# EAGLE design SMPS-BENCH (EAGLE 9.6.2)
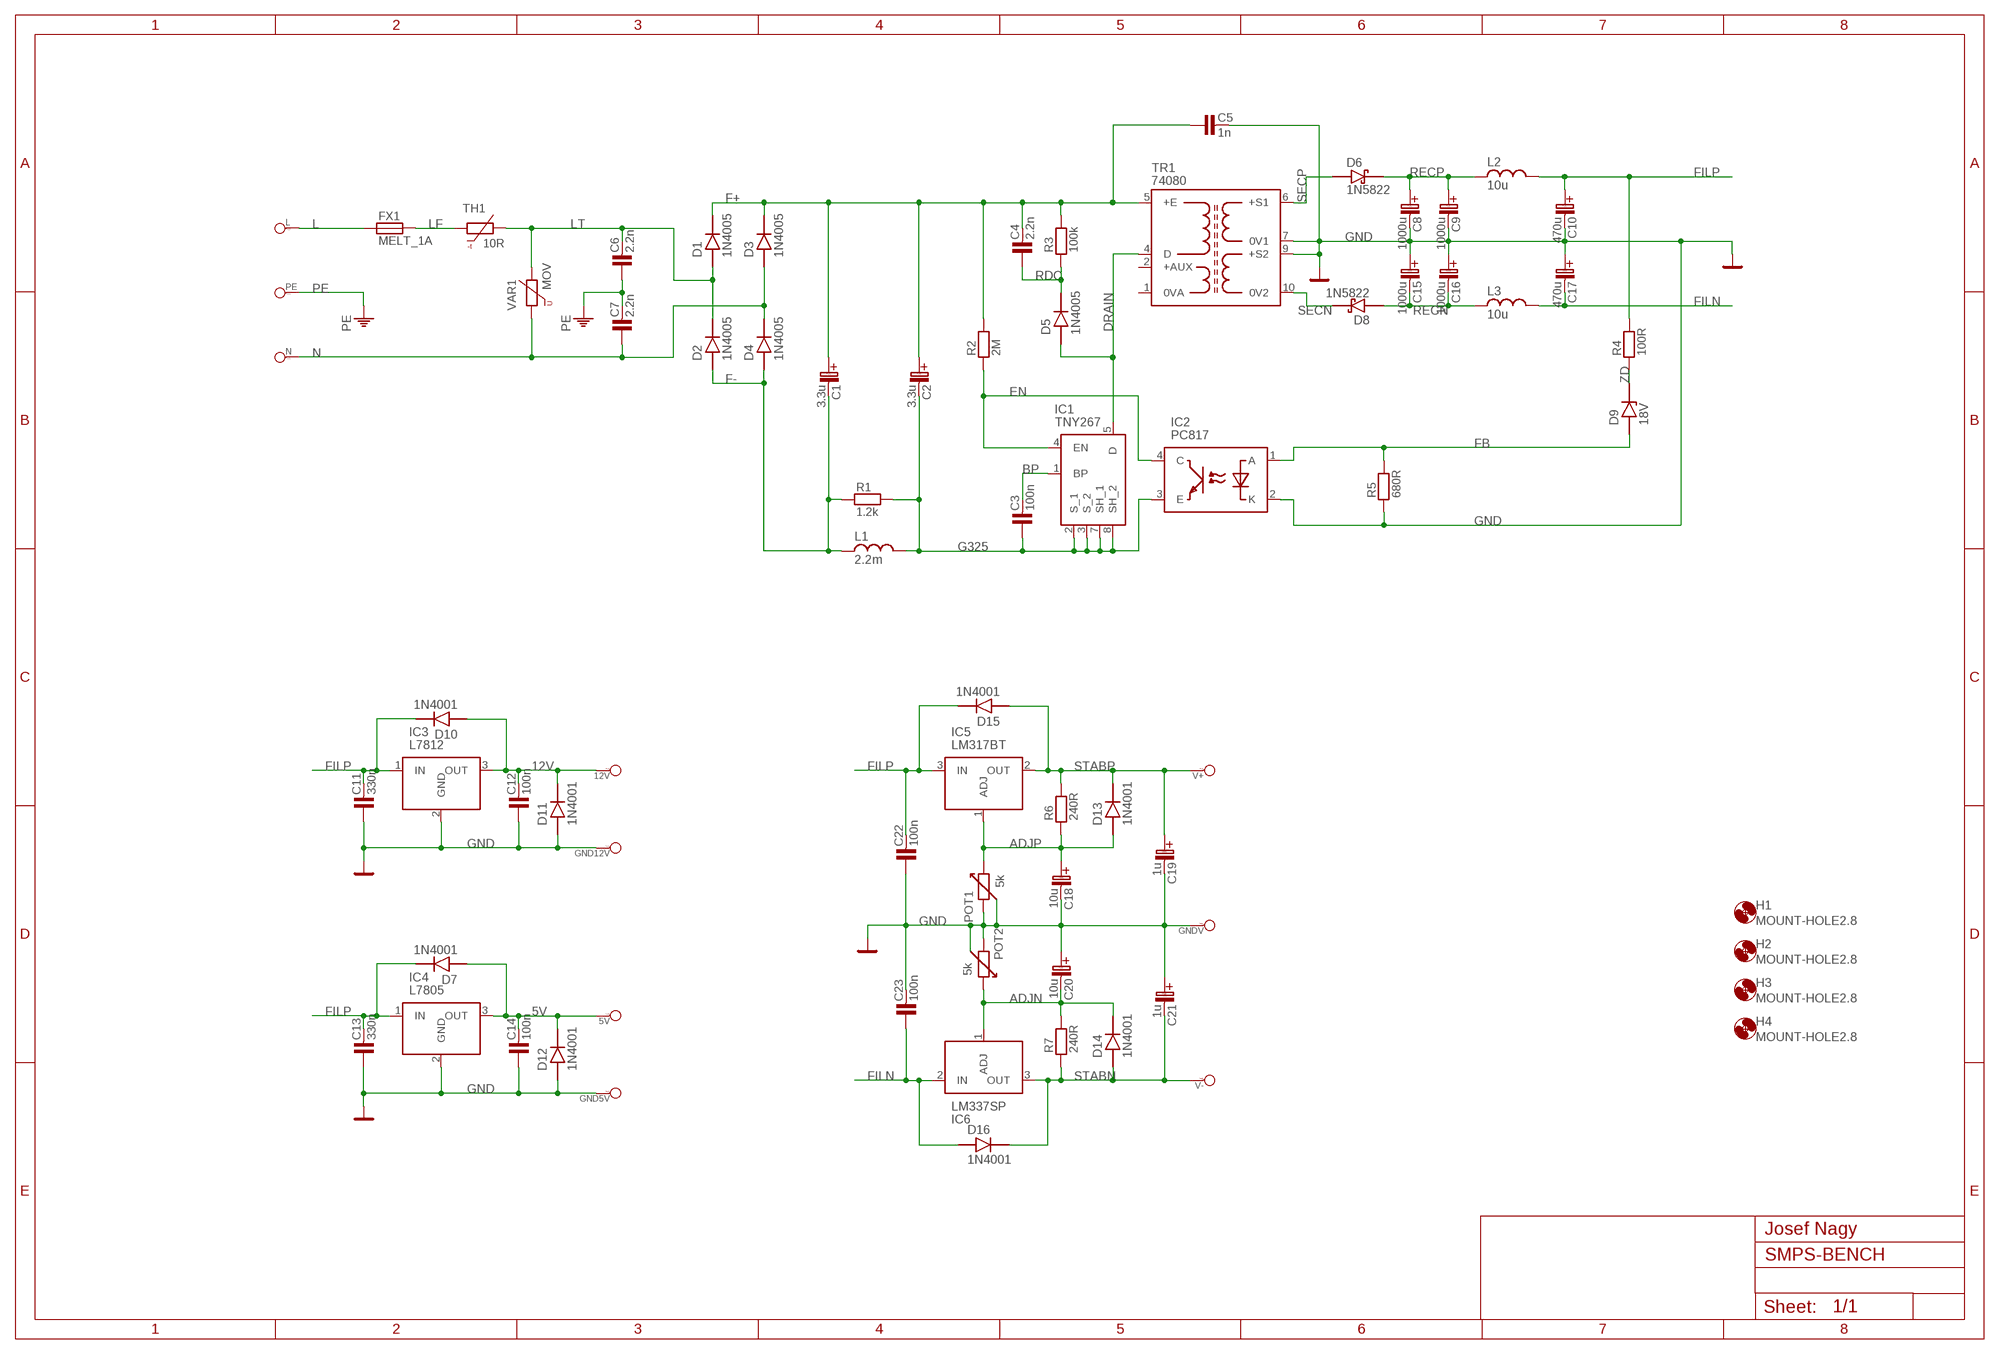
[diagram p0: schematic, sheet 1]

## Parts
5V  PAD_1  [PAD_1]
12V  PAD_1  [PAD_1]
C1  3.3u  C-EL_5  [C-EL_5]
C2  3.3u  C-EL_5  [C-EL_5]
C3  100n  C_KER_10  [C-10]
C4  2.2n  C_KER_10  [C-10]
C5  1n  C_KER_10  [C-10]
C6  2.2n  C_KER_10  [C-10]
C7  2.2n  C_KER_10  [C-10]
C8  1000u  C-EL_5  [C-EL_5]
C9  1000u  C-EL_5  [C-EL_5]
C10  470u  C-EL_5  [C-EL_5]
C11  330n  C_KER_5  [C-5]
C12  100n  C_KER_2,5  [C-2,5]
C13  330n  C_KER_5  [C-5]
C14  100n  C_KER_2,5  [C-2,5]
C15  1000u  C-EL_5  [C-EL_5]
C16  1000u  C-EL_5  [C-EL_5]
C17  470u  C-EL_5  [C-EL_5]
C18  10u  C-EL_2  [C-EL_2]
C19  1u  C-EL_2  [C-EL_2]
C20  10u  C-EL_2  [C-EL_2]
C21  1u  C-EL_2  [C-EL_2]
C22  100n  C_KER_5  [C-5]
C23  100n  C_KER_5  [C-5]
D1  1N4005  D_DO41  [DO41]
D2  1N4005  D_DO41  [DO41]
D3  1N4005  D_DO41  [DO41]
D4  1N4005  D_DO41  [DO41]
D5  1N4005  D_DO41  [DO41]
D6  1N5822  D-SCHOTTKY_DO201V  [DO201_V]
D7  1N4001  D_DO41  [DO41]
D8  1N5822  D-SCHOTTKY_DO201V  [DO201_V]
D9  18V  D-ZENER_DO35  [DO35]
D10  1N4001  D_DO41  [DO41]
D11  1N4001  D_DO41  [DO41]
D12  1N4001  D_DO41  [DO41]
D13  1N4001  D_DO41  [DO41]
D14  1N4001  D_DO41  [DO41]
D15  1N4001  D_DO41  [DO41]
D16  1N4001  D_DO41  [DO41]
FX1  MELT_1A  FUSE_M  [FUSE_MELT]
GND5V  PAD_1  [PAD_1]
GND12V  PAD_1  [PAD_1]
GNDV  PAD_1  [PAD_1]
H1  MOUNT-HOLE2.8  [2,8]
H2  MOUNT-HOLE2.8  [2,8]
H3  MOUNT-HOLE2.8  [2,8]
H4  MOUNT-HOLE2.8  [2,8]
IC1  TNY267  TNY267PN  [P-PACKAGE(DIP-8B)_1]
IC2  PC817  PC817X4NSZ1B  [DIP762W60P254L460H455Q4N]
IC3  L7812  L78XX  [TO255P460X1020X2008-3P]
IC4  L7805  L78XX  [TO255P460X1020X2008-3P]
IC5  LM317BT  [TO255P460X1020X2008-3P]
IC6  LM337SP  [TO255P460X1020X2008-3P]
L  PAD_1  [PAD_1]
L1  2.2m  L_5  [L-5]
L2  10u  L_3  [L-3]
L3  10u  L_3  [L-3]
N  PAD_1  [PAD_1]
PE  PAD_1  [PAD_1]
POT1  5k  POTENTIOMETER_1  [POT]
POT2  5k  POTENTIOMETER_1  [POT]
R1  1.2k  R_7,5  [R-7,5]
R2  2M  R_STOJ2  [R-STOJ2]
R3  100k  R_7,5  [R-7,5]
R4  100R  R_7,5  [R-7,5]
R5  680R  R_7,5  [R-7,5]
R6  240R  R_5  [R-5]
R7  240R  R_5  [R-5]
TH1  10R  THERMISTOR_1  [THERMISTOR]
TR1  74080  [74080]
V+  PAD_1  [PAD_1]
V-  PAD_1  [PAD_1]
VAR1  MOV  VARISTOR_1  [MOV_VARISTOR]

## Nets
5V: 5V.1 C14.2 D7.A D12.K(C) IC4.3(OUT)
12V: 12V.1 C12.2 D10.A D11.K(C) IC3.3(OUT)
ADJN: C20.C-(C_EL-) D14.K(C) IC6.1(ADJ) POT2.3 R7.2
ADJP: C18.C+(C_EL+) D13.A IC5.1(ADJ) POT1.3 R6.1
BP: C3.2 IC1.1(BP)
DRAIN: D5.A IC1.5(D) TR1.4(D)
EN: IC1.4(EN) IC2.4(C) R2.1
F+: C1.C+(C_EL+) C2.C+(C_EL+) C4.2 C5.1 D1.K(C) D3.K(C) R2.2 R3.2 TR1.5(+E)
F-: C1.C-(C_EL-) D2.A D4.A L1.1 R1.1
FB: D9.A IC2.1(A) R5.2
FILN: C17.C-(C_EL-) C23.1 D16.A IC6.2(IN) L3.2
FILP: C10.C+(C_EL+) C11.2 C13.2 C22.2 D7.K(C) D10.K(C) D15.K(C) IC3.1(IN) IC4.1(IN) IC5.3(IN) L2.2 R4.2
G325: C2.C-(C_EL-) C3.1 IC1.2(S_1) IC1.3(S_2) IC1.7(SH_1) IC1.8(SH_2) IC2.3(E) L1.2 R1.2
GND: C5.2 C8.C-(C_EL-) C9.C-(C_EL-) C10.C-(C_EL-) C11.1 C12.1 C13.1 C14.1 C15.C+(C_EL+) C16.C+(C_EL+) C17.C+(C_EL+) C18.C-(C_EL-) C19.C-(C_EL-) C20.C+(C_EL+) C21.C+(C_EL+) C22.1 C23.2 D11.A D12.A GND5V.1 GND12V.1 GNDV.1 IC2.2(K) IC3.2(GND) IC4.2(GND) POT1.1 POT1.2 POT2.1 POT2.2 R5.1 TR1.7(0V1) TR1.9(+S2)
L: FX1.1 L.1
LF: FX1.2 TH1.1
LT: C6.2 D1.A D2.K(C) TH1.2 VAR1.2
N: C7.1 D3.A D4.K(C) N.1 VAR1.1
PE: C6.1 C7.2 PE.1
RDC: C4.1 D5.K(C) R3.1
RECN: C15.C-(C_EL-) C16.C-(C_EL-) D8.A L3.1
RECP: C8.C+(C_EL+) C9.C+(C_EL+) D6.K(C) L2.1
SECN: D8.K(C) TR1.10(0V2)
SECP: D6.A TR1.6(+S1)
STABN: C21.C-(C_EL-) D14.A D16.K(C) IC6.3(OUT) R7.1 V-.1
STABP: C19.C+(C_EL+) D13.K(C) D15.A IC5.2(OUT) R6.2 V+.1
ZD: D9.K(C) R4.1
Unconnected: TR1.1(0VA) TR1.2(+AUX)

## Notes on the sheet
- Josef Nagy

## Library data of the parts
5V 12V GND5V GND12V GNDV L N PE V+ V- = #PaJa_31:PAD_1: Pajeci bod - 2,54 mm prumer
C1 C2 C8-C10 C15-C21 = #_NG_knihovna:C-EL: Kondenzator - elektrolyticky
C3-C7 C11-C14 C22 C23 = #_NG_knihovna:C_KER: Kondenzator - keramicky
D1-D5 D7 D10-D16 = #_NG_knihovna:D
D6 D8 = #_NG_knihovna:D-SCHOTTKY; SPICEPREFIX: D
D9 = #_NG_knihovna:D-ZENER
FX1 = #_NG_knihovna:FUSE
H1-H4 = #_NG_knihovna:MOUNT-HOLE: MOUNTING HOLE with drill center marker
IC1 = #_NG_knihovna:TNY267PN: AC/DC Converters 12W 85-265 VAC 19W/230 VAC Source: Datasheet <https://componentsearchengine.com/Datasheets/1/TNY267PN.pdf>; DESCRIPTION: AC/DC Converters 12W 85-265 VAC 19W/230 VAC; HEIGHT: mm; MANUFACTURER_NAME: Power Integrations; MANUFACTURER_PART_NUMBER: TNY267PN
IC2 = #_NG_knihovna:PC817X4NSZ1B: Transistor Output Optocouplers OPTOISOLATOR 5KV TRANS DIP, Optoisolator Transistor Output 1 Channel Source: Datasheet <https://componentsearchengine.com/Datasheets/1/PC817X4NSZ1B.pdf>; DESCRIPTION: Transistor Output Optocouplers OPTOISOLATOR 5KV TRANS DIP, Optoisolator Transistor Output 1 Channel; HEIGHT: 4.55mm; MANUFACTURER_NAME: Sharp Microelectronics; MANUFACTURER_PART_NUMBER: PC817X4NSZ1B
IC3 IC4 = #_NG_knihovna:L78XX
IC5 = #_NG_knihovna:LM317BT: Standard Regulator Pos 1.2V to 37V 0.4A 3-Pin(3+Tab) TO-220AB Tube Source: Datasheet <https://www.st.com/resource/en/datasheet/lm317.pdf>; DESCRIPTION: Standard Regulator Pos 1.2V to 37V 0.4A 3-Pin(3+Tab) TO-220AB Tube; HEIGHT: 4.6mm; MANUFACTURER_NAME: STMicroelectronics; MANUFACTURER_PART_NUMBER: LM317BT
IC6 = #_NG_knihovna:LM337SP: Source: Datasheet <http://www.st.com/web/en/resource/technical/document/datasheet/CD00000468.pdf>; HEIGHT: 4.6mm; MANUFACTURER_NAME: STMicroelectronics; MANUFACTURER_PART_NUMBER: LM337SP
L1-L3 = #_NG_knihovna:L
POT1 POT2 = #_NG_knihovna:POTENTIOMETER
R1-R7 = #_NG_knihovna:R: Rezistor
TH1 = #_NG_knihovna:THERMISTOR
TR1 = #_NG_knihovna:74080: Transformer: impulse; 185VAC,265VAC; 915V; 915V; 1.5A; 1.5A; PCB Source: Datasheet <https://www.tme.com/Document/74b1c6fdfa5c80edd28be424718b4d1b/74080.pdf>; DESCRIPTION: Transformer: impulse; 185VAC,265VAC; 915V; 915V; 1.5A; 1.5A; PCB; HEIGHT: 18mm; MANUFACTURER_NAME: MYRRA; MANUFACTURER_PART_NUMBER: 74080
VAR1 = #_NG_knihovna:VARISTOR

## Board
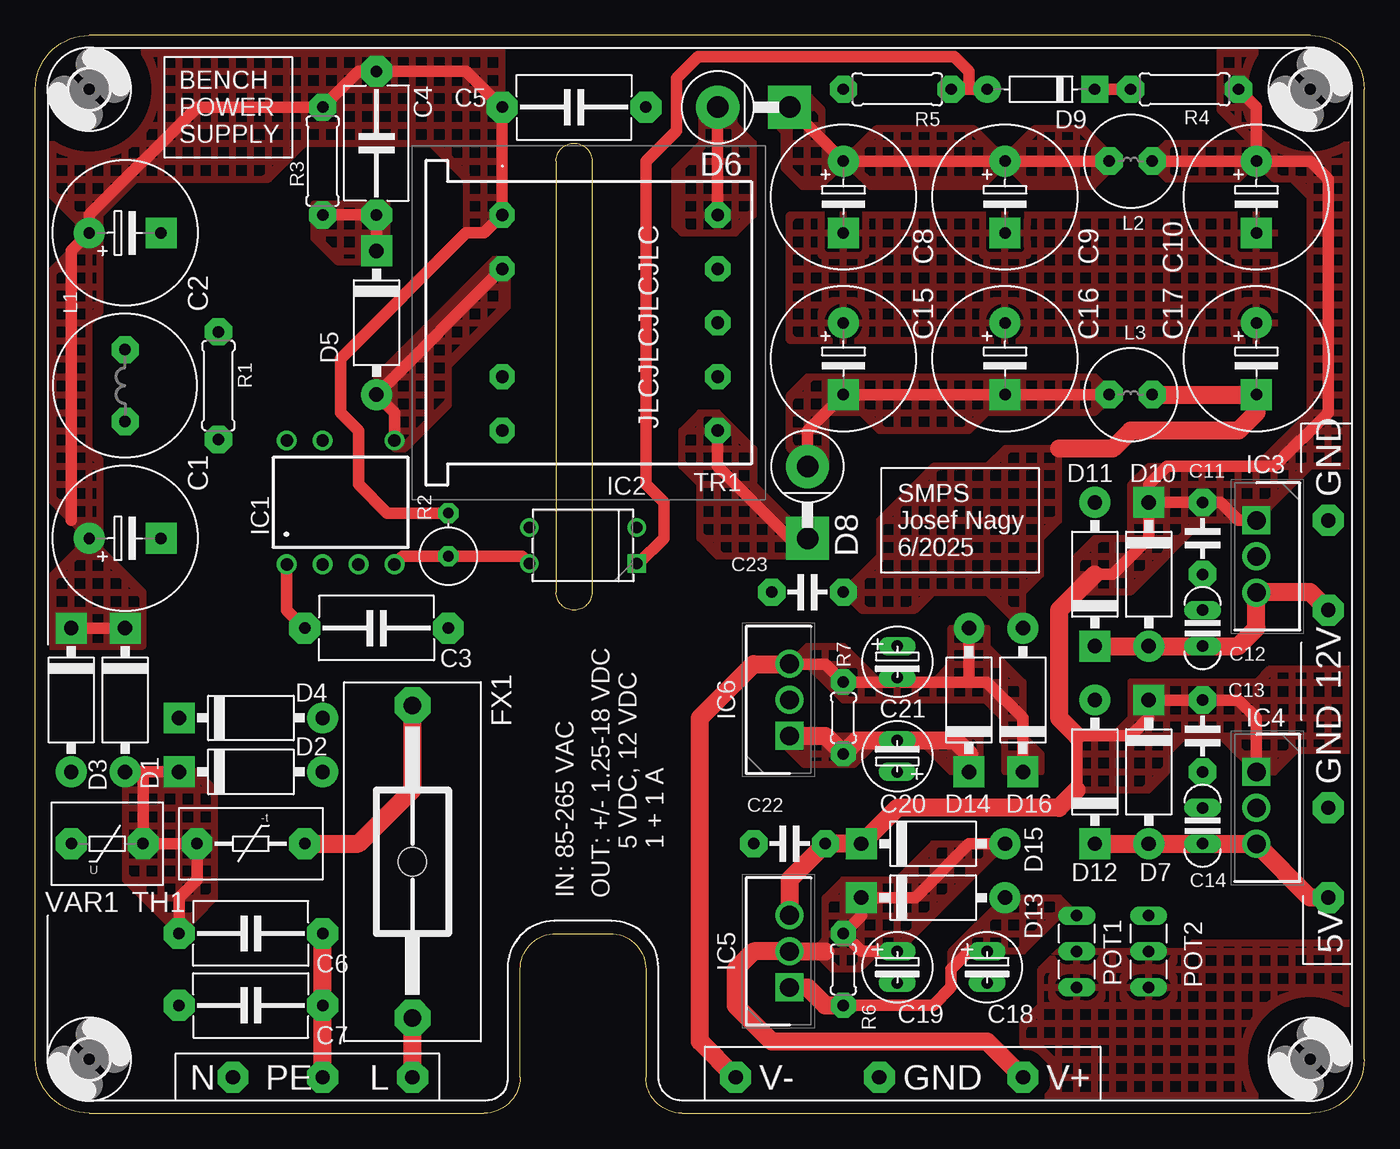
[diagram p1: board, top side]
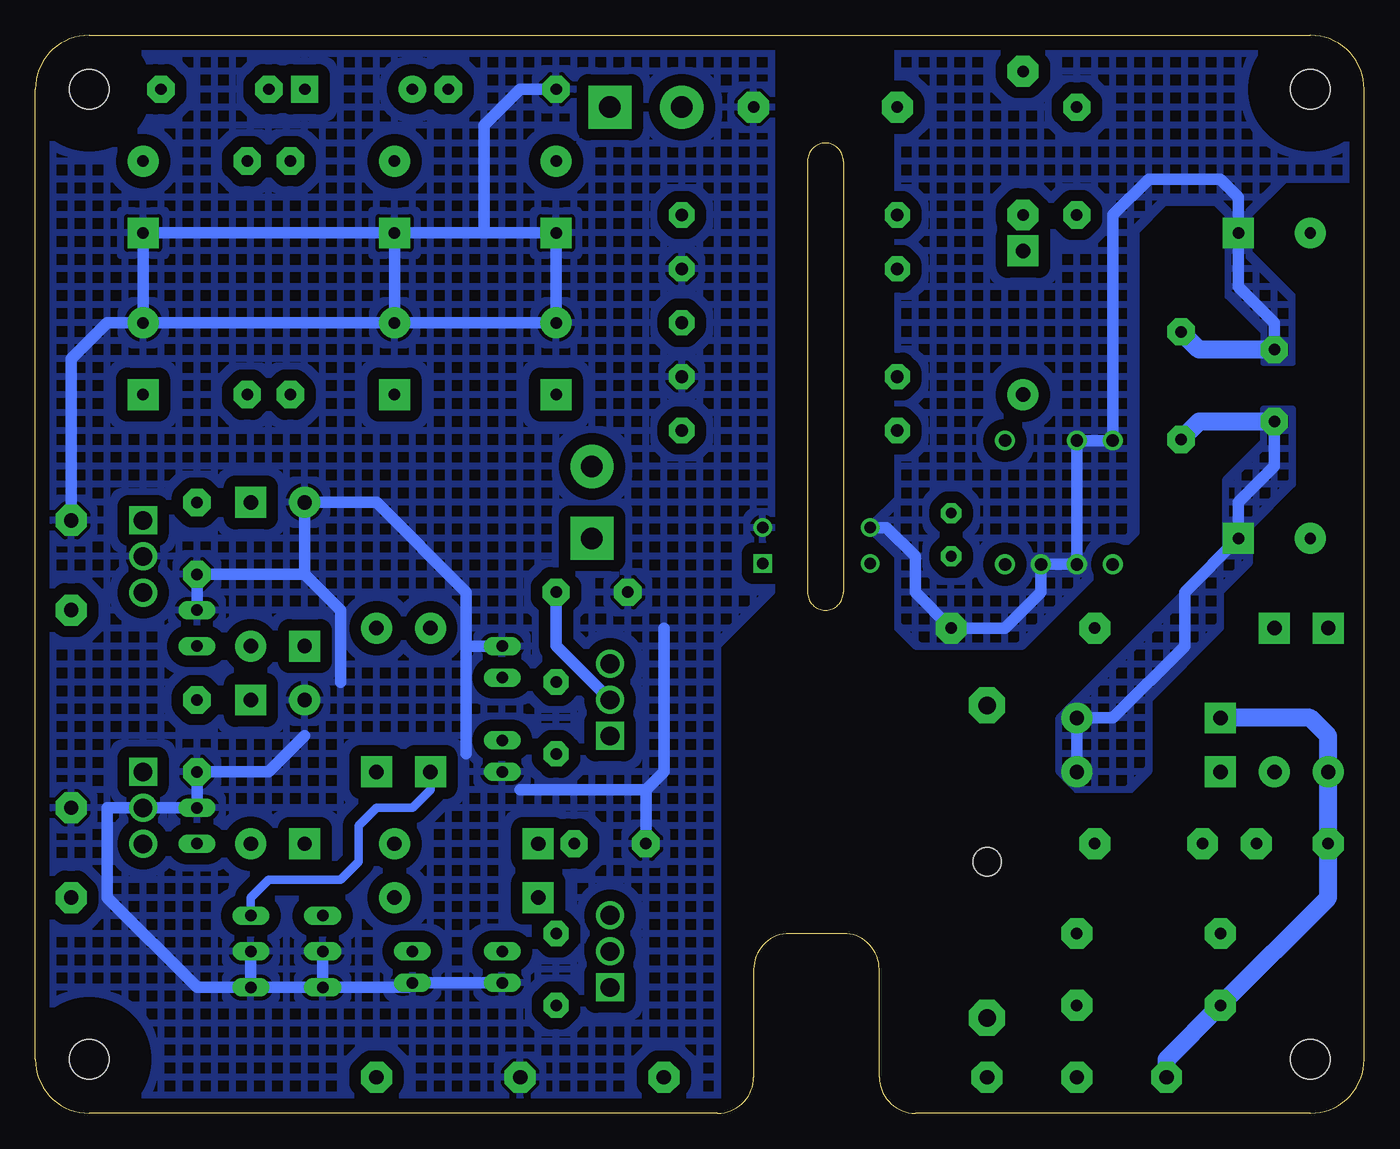
[diagram p2: board, bottom side, seen from below]

Size 93.98 x 76.2 mm. Coordinates in mm from the lower left corner, seen from the top.
Outline: 0,72.39 arc-90 3.81,76.2 90.17,76.2 arc-90 93.98,72.39 93.98,3.81 arc-90 90.17,0 45.72,0 arc-90 43.18,2.54 43.18,10.16 arc90 40.64,12.7 36.83,12.7 arc90 34.29,10.16 34.29,2.54 arc-90 31.75,0 3.81,0 arc-90 0,3.81 0,72.39
Outline: 36.83,67.31 36.83,36.83 arc180 39.37,36.83 39.37,67.31 arc180 36.83,67.31
Copper layers (1*16): Top 0.035mm / dielectric 1.5mm / Bottom 0.035mm
Design rules "default": minimum track width 6mil, minimum drill 0.35mm, track to track 6mil, track to pad 6mil, pad to pad 6mil, via to via 6mil, smd to smd 6mil, copper to edge 40mil, drill to drill 6mil, minimum pad ring 10mil, minimum via ring 8mil, stop-mask expansion 4mil, vias tented up to drill 0mil, thermal gap 10mil

### Footprints (pad centres in the part's own frame; a part is rotated, then mirrored left to right if it is on the bottom)
PAD_1 = drill 1.016 pad 2.184 octagon: 1 0,0
C-EL_5 = drill 0.813 pad 2.184: C+ -2.54,0 | drill 0.813 pad 2.184 square: C- 2.54,0
C-10 = drill 0.813 pad 2.184 octagon: 1 -5.08,0; 2 5.08,0
C-5 = drill 0.813 pad 1.93 octagon: 1 -2.54,0; 2 2.54,0
C-2,5 = drill 0.813 pad 1.27 long: 1 -1.27,0; 2 1.27,0
C-EL_2 = drill 0.813 pad 1.27 long: C+ 0,0; C- 2.223,0
DO41 = drill 1.016 pad 2.184: A -5.08,0 | drill 1.016 pad 2.184 square: K 5.08,0
DO201_V = drill 1.524 pad 3.048: A -2.54,0 | drill 1.524 pad 3.048 square: K 2.54,0
DO35 = drill 0.813 pad 1.93: A -3.81,0 | drill 0.813 pad 1.93 square: K 3.81,0
FUSE_MELT = drill 1.219 pad 2.54 octagon: 1 -11.049,0; 2 11.049,0 | hole 2: 0,0
2,8 = hole 2.8: 0,0
P-PACKAGE(DIP-8B)_1 = drill 0.88 pad 1.4: 1 -3.81,-4.375; 2 -1.27,-4.375; 3 1.27,-4.375; 4 3.81,-4.375; 5 3.81,4.375; 7 -1.27,4.375; 8 -3.81,4.375
DIP762W60P254L460H455Q4N = drill 0.8 pad 1.27 square: 1 -3.81,1.27 | drill 0.8 pad 1.27: 2 -3.81,-1.27; 3 3.81,-1.27; 4 3.81,1.27
TO255P460X1020X2008-3P = drill 1.32 pad 1.98 square: 1 0,0 | drill 1.32 pad 1.98: 2 2.55,0; 3 5.1,0
L-5 = drill 0.813 pad 1.93 octagon: 1 -2.54,0; 2 2.54,0
L-3 = drill 0.813 pad 1.93 octagon: 1 -1.524,0; 2 1.524,0
POT = drill 0.813 long: 1 -2.54,0; 2 0,0; 3 2.54,0
R-7,5 = drill 0.813 pad 1.93 octagon: 1 -3.81,0; 2 3.81,0
R-STOJ2 = drill 0.75 pad 1.422 octagon: 1 -1.27,0; 2 1.778,0
R-5 = drill 0.813 pad 1.778 octagon: 1 -2.54,0; 2 2.54,0
THERMISTOR = drill 0.813 pad 2.184 octagon: 1 -3.81,0; 2 3.81,0
74080 = drill 0.9 pad 1.778 octagon: 1 0,-15.24; 2 0,-11.43; 4 0,-3.81; 5 0,0; 6 15.24,0; 7 15.24,-3.81; 8 15.24,-7.62; 9 15.24,-11.43; 10 15.24,-15.24
MOV_VARISTOR = drill 0.813 pad 2.184 octagon: 1 -2.54,0; 2 2.54,0

### Placement (x,y rotation side)
5V  91.44,15.24 270 top
12V  91.44,35.56 270 top
C1  6.35,40.64 0 top
C2  6.35,62.23 0 top
C3  24.13,34.29 180 top
C4  24.13,68.58 90 top
C5  38.1,71.12 0 top
C6  15.24,12.7 180 top
C7  15.24,7.62 0 top
C8  57.15,64.77 270 top
C9  68.58,64.77 270 top
C10  86.36,64.77 270 top
C11  82.55,40.64 90 top
C12  82.55,34.29 270 top
C13  82.55,26.67 90 top
C14  82.55,20.32 270 top
C15  57.15,53.34 270 top
C16  68.58,53.34 270 top
C17  86.36,53.34 270 top
C18  67.31,11.43 270 top
C19  60.96,11.43 270 top
C20  60.96,24.13 90 top
C21  60.96,33.02 270 top
C22  53.34,19.05 0 top
C23  54.61,36.83 180 top
D1  6.35,29.21 90 top
D2  15.24,24.13 180 top
D3  2.54,29.21 90 top
D4  15.24,27.94 180 top
D5  24.13,55.88 90 top
D6  50.8,71.12 0 top
D7  78.74,24.13 90 top
D8  54.61,43.18 270 top
D9  71.12,72.39 0 top
D10  78.74,38.1 90 top
D11  74.93,38.1 270 top
D12  74.93,24.13 270 top
D13  63.5,15.24 180 top
D14  66.04,29.21 270 top
D15  63.5,19.05 180 top
D16  69.85,29.21 270 top
FX1  26.67,17.78 90 top
GND5V  91.44,21.59 270 top
GND12V  91.44,41.91 270 top
GNDV  59.69,2.54 0 top
H1  3.81,3.81 0 top
H2  3.81,72.39 0 top
H3  90.17,3.81 0 top
H4  90.17,72.39 0 top
IC1  21.59,43.18 0 top
IC2  38.73,40.13 180 top
IC3  86.36,41.91 270 top
IC4  86.36,24.13 270 top
IC5  53.34,8.89 90 top
IC6  53.34,26.67 90 top
L  26.67,2.54 0 top
L1  6.35,51.44 90 top
L2  77.47,67.31 0 top
L3  77.47,50.8 0 top
N  13.97,2.54 0 top
PE  20.32,2.54 0 top
POT1  73.66,11.43 90 top
POT2  78.74,11.43 90 top
R1  12.95,51.44 90 top
R2  29.21,40.64 90 top
R3  20.32,67.31 90 top
R4  81.28,72.39 0 top
R5  60.96,72.39 0 top
R6  57.15,10.16 90 top
R7  57.15,27.94 270 top
TH1  15.24,19.05 180 top
TR1  33.02,63.5 0 top
V+  69.85,2.54 0 top
V-  49.53,2.54 0 top
VAR1  5.08,19.05 0 top

### Tracks (layer width: path | path; a pad name or v marks a point on that pad's centre or on a via)
5V
  Top 1.27: D12.K D7.A C14.2 86.34,19.05 IC4.3 90.15,15.24 5V.1
12V
  Top 1.27: D11.K D10.A C12.2 85.09,33.02 86.36,34.29 IC3.3 86.38,36.83 90.17,36.83 12V.1
ADJN
  Top 1.27: IC6.1 55.88,26.67 R7.2 58.1,26.35 C20.C- 65.09,26.35 66.04,25.4 D14.K
  Bottom 0.61: D14.K 66.04,22.86 67.31,21.59 69.85,21.59 71.12,20.32 71.12,17.78 72.39,16.51 77.47,16.51 78.74,15.24 POT2.3
  pour Top (isolate 0.813, no thermals, hatched): 53.34,26.67 66.8,26.67 66.8,24.13 64.77,24.13 62.87,26.04 59.31,26.04 57.91,24.64 54.36,24.64 53.09,25.91 53.09,26.42
ADJP
  Top 0.813: C18.C+ 66.04,11.43 64.77,10.16 64.77,8.89 63.5,7.62 R6.1
  Top 1.27: IC5.1 54.61,8.89 55.88,7.62 R6.1
  pour Top (isolate 0.813, no thermals, hatched): 64.77,10.16 64.77,11.43 68.58,15.24 72.39,15.24 73.66,13.97 72.39,13.97 69.85,11.43 67.31,11.43 66.04,11.43
BP
  Top 0.813: C3.2 17.78,35.56 IC1.1
DRAIN
  Top 0.813: IC1.5 25.4,49.53 D5.A TR1.4
  pour Top (isolate 0.813, no thermals, hatched): 24.13,50.8 25.4,49.53 25.4,46.99 26.16,46.99 29.21,50.04 29.21,52.83 33.4,57.02 33.4,59.56 32.51,60.45 24.13,52.07
EN
  Top 0.813: IC1.4 25.96,39.37 R2.1 34.42,39.37 IC2.4
F+
  Top 0.813: 2.54,41.91 2.54,60.96 C2.C+ 3.81,63.5 11.43,71.12 R3.2 22.86,73.66 C4.2 30.48,73.66 C5.1 TR1.5 31.75,62.23 30.48,62.23 21.59,53.34 21.59,49.53 22.86,48.26 22.86,44.45 24.89,42.42 R2.2 | D3.K D1.K
  pour Top (isolate 0.813, no thermals, hatched): 33.02,63.5 33.02,76.2 0,76.2 0,66.04 3.05,62.99 3.05,61.47 0,58.42 0,44.45 3.05,41.4 3.05,39.88 0,36.83 0,33.02 7.62,33.02 7.62,36.83 4.57,39.88 4.57,46.23 3.81,46.99 3.81,55.88 4.57,56.64 4.57,63.5 7.11,66.04 16.51,66.04 19.05,68.58 27.94,68.58 30.48,66.04 30.48,62.23 31.75,62.23
F-
  Bottom 0.813: L1.1 6.35,45.72 8.89,43.18 C1.C- 12.7,36.83 12.7,33.02 17.78,27.94 D4.A D2.A
  Bottom 1.27: L1.1 11.68,48.89 R1.1
  pour Bottom (isolate 0.813, no thermals, hatched): 7.11,49.78 5.08,49.78 5.08,44.45 8.13,41.4 8.13,38.86 10.16,36.83 10.16,34.29 15.24,29.21 15.24,24.13 16.51,22.86 20.32,22.86 21.59,24.13 21.59,27.94 9.78,39.75 9.78,44.83 7.11,47.5
FB
  Top 0.813: D9.A 66.04,72.39 | 66.04,72.39 R5.2 | 66.04,72.39 66.04,73.66 65,74.7 46.86,74.7 45.34,73.18 45.34,69.47 43.18,67.31 43.18,44.45 44.45,43.18 44.45,40.64 42.67,38.86 IC2.1
FILN
  Top 1.27: L3.2 C17.C- 86.36,49.53 85.09,48.26 77.47,48.26 76.2,46.99 72.39,46.99
  Bottom 0.813: C23.1 57.15,33.03 IC6.2
  pour Top (isolate 0.813, no thermals, hatched): 72.39,46.99 68.58,46.99 67.31,45.72 63.5,45.72 59.69,41.91 59.69,39.37 57.15,36.83 58.42,35.56 62.23,35.56 63.5,36.83 67.31,36.83 69.85,34.29 69.85,35.56 69.85,36.83 71.12,38.1 71.12,40.64 72.39,41.91
FILP
  Top 0.813: C10.C+ L2.2 | C10.C+ 86.36,71.12 R4.2 | D10.K C11.2 83.82,43.18 85.09,41.91 IC3.1 | IC4.1 86.36,27.94 85.09,29.21 C13.2 D7.K 78.74,27.94 77.47,26.67 73.66,26.67 73.66,22.86 | C10.C+ 90.17,67.31 91.44,66.04 91.44,49.53 87.63,45.72 80.01,45.72 78.74,44.45 D10.K | D10.K 78.74,40.64 76.2,38.1 74.93,38.1
  Top 1.27: 74.93,38.1 72.39,35.56 72.39,27.94 73.66,26.67 | 73.66,22.86 72.39,21.59 60.96,21.59 D15.K C22.2 53.34,16.51 IC5.3
  pour Top (isolate 0.813, no thermals, hatched): 78.69,67.36 80.01,68.58 85.6,68.58 85.85,68.83 83.82,70.87 83.82,76.2 93.98,76.2 93.98,45.72 90.17,45.72 86.36,41.91 82.55,41.91 77.47,36.83 73.66,36.83 73.66,39.37 74.93,40.64 77.47,40.64 77.47,44.45 78.74,45.72 86.36,45.72 90.17,49.53 90.17,64.77 88.9,66.04 87.63,66.04 86.36,67.31 85.09,66.04 80.01,66.04
  pour Top (isolate 0.813, no thermals, hatched): 86.36,24.13 87.63,24.13 89.15,25.65 93.98,25.65 93.98,31.37 87.25,31.37 86.36,30.48 77.47,30.48 77.47,27.94 76.2,26.67 73.66,26.67 73.66,22.86 78.74,22.86 80.01,24.13 80.01,25.4 81.28,26.67 83.82,26.67
G325
  Bottom 0.813: L1.2 6.35,55.88 8.89,58.42 C2.C- 8.89,64.77 10.16,66.04 15.24,66.04 17.78,63.5 IC1.8 IC1.7 IC1.2 IC1.3 22.86,36.83 25.4,34.29 C3.1 31.75,36.83 31.75,39.37 33.78,41.4 IC2.3
  Bottom 1.27: L1.2 11.68,53.98 R1.2
  pour Bottom (isolate 0.813, no thermals, hatched): 7.11,53.09 5.08,53.09 5.08,57.78 8.13,60.83 8.13,63.5 5.59,66.04 0,66.04 0,76.2 33.02,76.2 33.02,43.43 34.8,41.66 34.8,41.15 33.02,39.37 33.02,34.29 31.75,33.02 24.13,33.02 16.13,41.02 16.13,62.36 14.1,64.39 10.54,64.39 9.65,63.5 9.65,57.78 7.11,55.25
GND
  Bottom 0.813: 62.23,62.23 C8.C- C15.C+ C16.C+ | 62.23,62.23 C9.C- | C9.C- C16.C+ | C9.C- C10.C- C17.C+ | C17.C+ C16.C+ | R5.1 59.69,72.39 62.23,69.85 62.23,62.23 | 74.93,26.67 77.47,24.13 C13.1 C14.1 IC4.2 88.9,21.59 88.9,15.24 82.55,8.89 POT2.1 | C12.1 C11.1 74.93,38.1 | IC3.2 | C19.C- C18.C- 67.63,8.89 POT1.1 | POT1.2 POT1.1 | POT2.2 POT2.1 | POT2.1 POT1.1 | 63.5,25.4 63.5,33.02 | 63.5,33.02 63.5,36.83 69.85,43.18 D11.A 74.93,38.1 | C21.C+ 63.5,33.02 | 74.93,38.1 73.66,36.83 72.39,35.56 72.39,30.48 | C17.C+ 88.9,55.88 91.44,53.34 GND12V.1 | 50.8,22.86 49.53,24.13 49.53,34.29 | C22.1 50.8,22.86 | 50.8,22.86 59.69,22.86
  pour Bottom (isolate 0.813, hatched): 41.91,76.2 41.91,36.83 45.72,33.02 45.72,6.35 45.72,0 93.98,0 93.98,76.2
  pour Top (isolate 0.813, hatched): 53.34,63.5 87.63,63.5 87.63,54.61 53.34,54.61
  pour Top (isolate 0.813, hatched): 69.85,0 69.85,6.35 71.12,7.62 71.12,10.16 72.39,11.43 81.28,11.43 81.91,12.07 93.98,12.07 93.98,0
L
  Top 1.27: L.1 FX1.1
LF
  Top 1.27: TH1.1 22.86,19.05 26.67,22.86 FX1.2
LT
  Top 0.813: D2.K 7.62,24.13 | 7.62,24.13 D1.A | C6.2 10.16,15.24 11.43,16.51 TH1.2 VAR1.2 7.62,24.13
  pour Top (isolate 0.813, no thermals, hatched): 6.35,24.13 6.35,19.05 6.35,16.51 10.16,12.7 11.43,13.97 12.7,15.24 12.7,22.86 11.43,24.13
N
  Bottom 1.27: N.1 13.97,3.81 C7.1 2.54,15.24 VAR1.1 D3.A 2.54,26.67 3.81,27.94 D4.K
PE
  Top 1.27: PE.1 C7.2 C6.1
RDC
  Top 0.813: R3.1 C4.1 D5.K
  pour Top (isolate 0.813, no thermals, hatched): 24.89,60.96 24.89,64.14 24.89,64.26 19.68,64.26 19.68,61.85 21.21,60.33 21.34,60.2 24.89,60.2 24.89,60.83
RECN
  Top 0.813: D8.A 54.61,48.26 C15.C- C16.C- L3.1
  pour Top (isolate 0.813, no thermals, hatched): 54.61,45.72 53.34,46.99 53.34,50.8 54.61,52.07 57.15,52.07 69.85,52.07 74.93,52.07 76.2,50.8 74.93,49.53 69.85,49.53 67.31,49.53 66.04,48.26 59.69,48.26 58.42,49.53 55.88,49.53 55.88,45.72
RECP
  Top 0.813: L2.1 C9.C+ C8.C+ D6.K
  pour Top (isolate 0.813, no thermals, hatched): 52.26,70.04 52.96,69.34 52.96,66.8 54.23,65.53 55.5,65.53 56.64,66.67 57.91,66.67 59.05,65.53 66.93,65.53 68.07,66.67 69.09,66.67 70.23,65.53 74.8,65.53 76.2,66.93 76.2,67.56 74.17,69.6 70.61,69.6 68.96,67.95 68.07,67.95 66.42,69.6 59.44,69.6 57.79,67.95 56.77,67.95 55.63,69.09 55.63,70.99 54.48,72.14 54.36,72.14
SECN
  Top 0.813: TR1.10 48.26,45.72 53.34,40.64 D8.K
  pour Top (isolate 0.813, no thermals, hatched): 48.26,49.53 50.8,46.99 50.8,44.45 53.34,41.91 55.88,41.91 55.88,39.37 48.26,39.37 46.99,40.64 46.99,44.45 45.72,45.72 45.72,48.26 46.99,49.53
SECP
  Top 0.813: D6.A TR1.6
  pour Top (isolate 0.813, no thermals, hatched): 47.12,71.12 47.12,68.58 45.21,66.67 45.21,62.74 45.72,62.23 49.53,62.23 50.8,63.5 50.8,68.58 49.53,69.85 49.4,69.98 49.4,71.12
STABN
  Top 0.813: 66.04,30.48 61.28,30.48 C21.C- 60.64,30.48 R7.1 55.88,31.75 53.36,31.75 IC6.3 53.32,31.75 | 66.04,30.48 D14.A | 66.04,30.48 67.31,30.48 69.85,27.94 D16.K
  Top 1.27: V-.1 46.99,5.08 46.99,27.94 50.8,31.75 53.36,31.75
  pour Top (isolate 0.813, no thermals, hatched): 53.34,31.75 54.61,33.02 57.15,33.02 59.69,30.48 63.5,30.48 64.77,31.75 64.77,34.29 67.31,34.29 67.31,33.02 69.85,30.48 69.85,26.67 71.12,25.4 71.12,24.13 68.58,24.13 68.58,27.81 67.18,29.21 57.15,29.21 54.61,31.75
STABP
  Top 0.813: C19.C+ 58.42,11.43 R6.2 58.42,13.97 D13.K 62.23,15.24 66.04,19.05 D15.A
  Top 1.27: V+.1 67.31,5.08 52.07,5.08 49.53,7.62 49.53,10.16 50.8,11.43 IC5.2 55.88,11.43
  pour Top (isolate 0.813, no thermals, hatched): 55.88,12.33 55.88,15.24 57.15,16.51 60.96,16.51 63.5,19.05 68.58,19.05 60.96,11.43 59.56,11.43 58.29,10.16 56.39,10.16 55.12,11.43
ZD
  Top 0.813: R4.1 D9.K

### Text on the board
tPlace: BENCH / POWER / SUPPLY | SMPS / Josef Nagy / 6/2025 | IN: 85-265 VAC | OUT: +/- 1.25-18 VDC / 5 VDC, 12 VDC / 1 + 1 A
tNames: JLCJLCJLCJLC | GND | 12V | GND | 5V | N | PE | L | V- | GND | V+